# Altium project DT10965_MOTOR_CONTROLLER.PrjPcb (part 1 of 8)
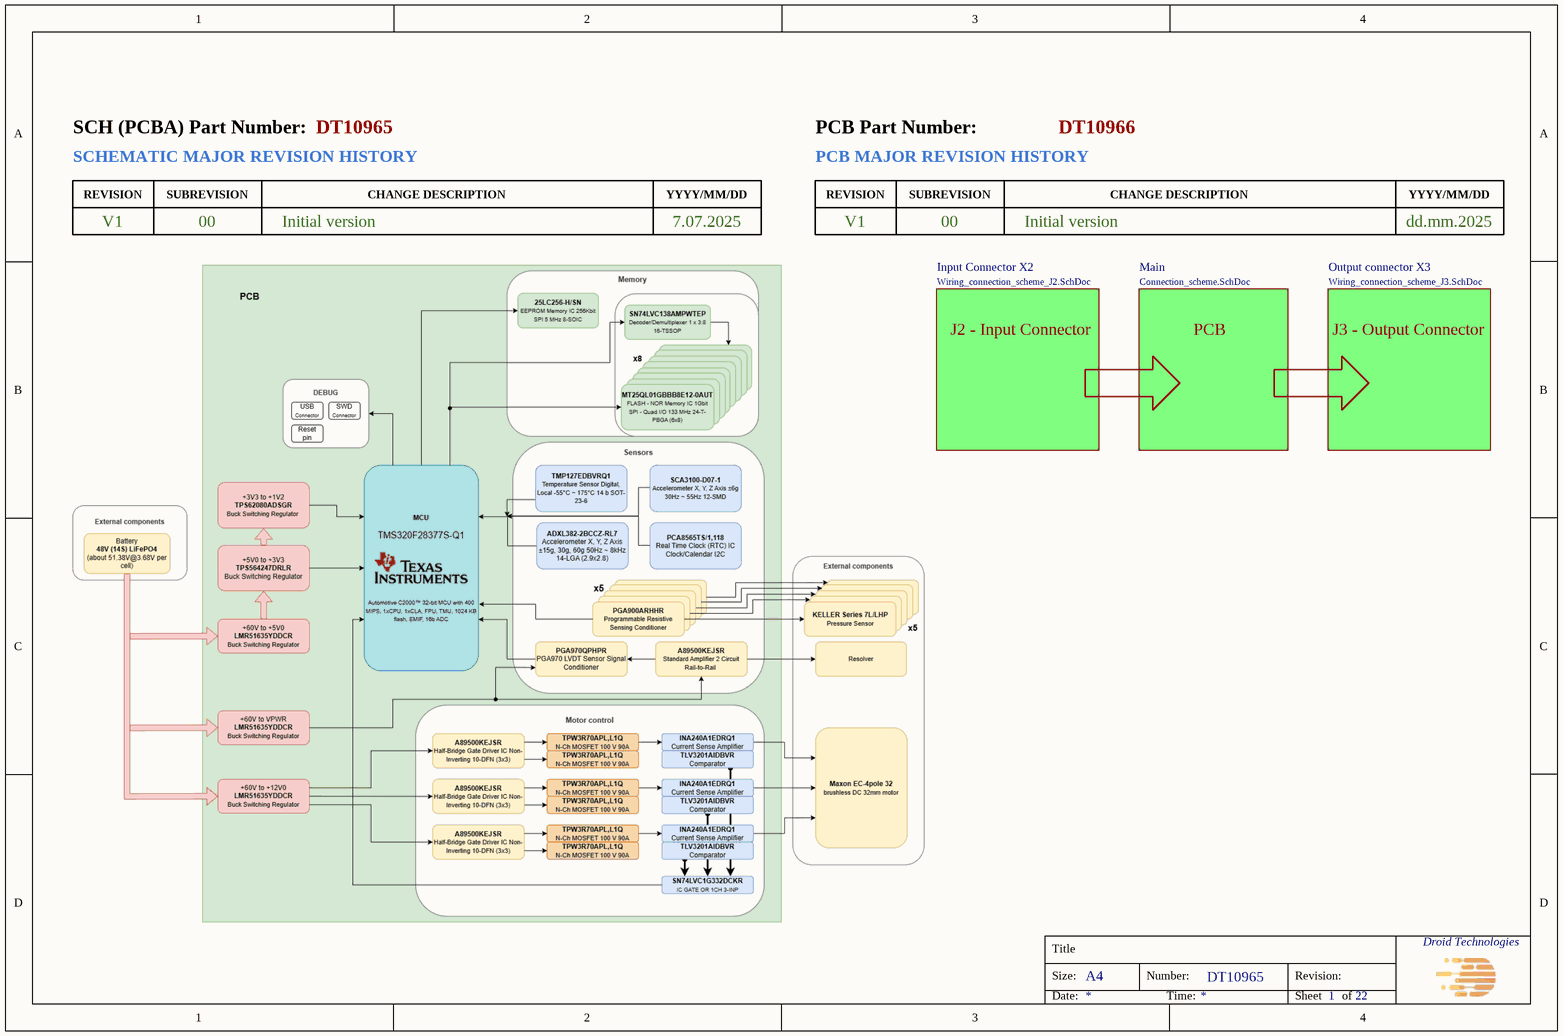
[diagram p0: Title.SchDoc]
CompanyName: Droid Technologies; DT_PCB_Number: DT10966; DT_PCB_Revision: 1.0; DT_SCH_Number: DT10965; DT_SCH_Revision: 1.0; DT_SCH_Title: MOTOR CONTROLLER
22 sheets, 745 parts. Net scope: strictly hierarchical (ports join the sheet entries above them; power ports are local).
Board file: DT10966_MOTOR_CONTROLLER.PcbDoc
Sheets:
  Title.SchDoc
    Main = Connection_scheme.SchDoc
      MCU = MCU.SchDoc
      DEBUG = MCU_debug.SchDoc
      FLASH = Flash_memory.SchDoc
      EEPROM = EEPROM_memory.SchDoc
      Temp_Sensor = Temp_sensor.SchDoc
      ACCELEROMETERS = Accelerometers.SchDoc
      H-Bridge = H-bridge.SchDoc
      Resolver = Resolver.SchDoc
      Phase Current/Voltage Sense = Phase_Current_Voltage_Sense.SchDoc
      PS1 = Pressure_sensor_AFE1.SchDoc
      Calendar = Calendar.SchDoc
      USB = USB_interface.SchDoc
      POWER = Power_management.SchDoc
      PS2 = Pressure_sensor_AFE2.SchDoc
      PS3 = Pressure_sensor_AFE3.SchDoc
      PS4 = PGA900_AFE_Reserved_4.SchDoc
      PS5 = PGA900_AFE_Reserved_5.SchDoc
      AMP = Motor Voltage AMP.SchDoc
    Input Connector X2 = Wiring_connection_scheme_J2.SchDoc
    Output connector X3 = Wiring_connection_scheme_J3.SchDoc

## Sheet Title.SchDoc: =DT_SCH_Title
size A4; Organization: Droid Technologies; DocumentNumber: DT10965; Revision: 1.0; SheetNumber: 1; SheetTotal: 22

### Sub-sheets
Input Connector X2 = Wiring_connection_scheme_J2.SchDoc: no entries
Main = Connection_scheme.SchDoc: no entries
Output connector X3 = Wiring_connection_scheme_J3.SchDoc: no entries

### Notes on the sheet
- V1
- 00
- Initial version
- 7.07.2025
- dd.mm.2025
- J2 - Input Connector
- PCB
- J3 - Output Connector
- SCHEMATIC MAJOR REVISION HISTORY
- SCH (PCBA) Part Number:
- PCB MAJOR REVISION HISTORY
- PCB Part Number:
- REVISION
- SUBREVISION
- CHANGE DESCRIPTION
- YYYY/MM/DD
- Title
- Size:
- A4
- Number:
- Revision:
- Date:
- Time:
- Sheet
- of

## Sheet Connection_scheme.SchDoc: =DT_SCH_Title
size A3; Organization: Droid Technologies; DocumentNumber: DT10965; Revision: 1.0; SheetNumber: 2; SheetTotal: 22
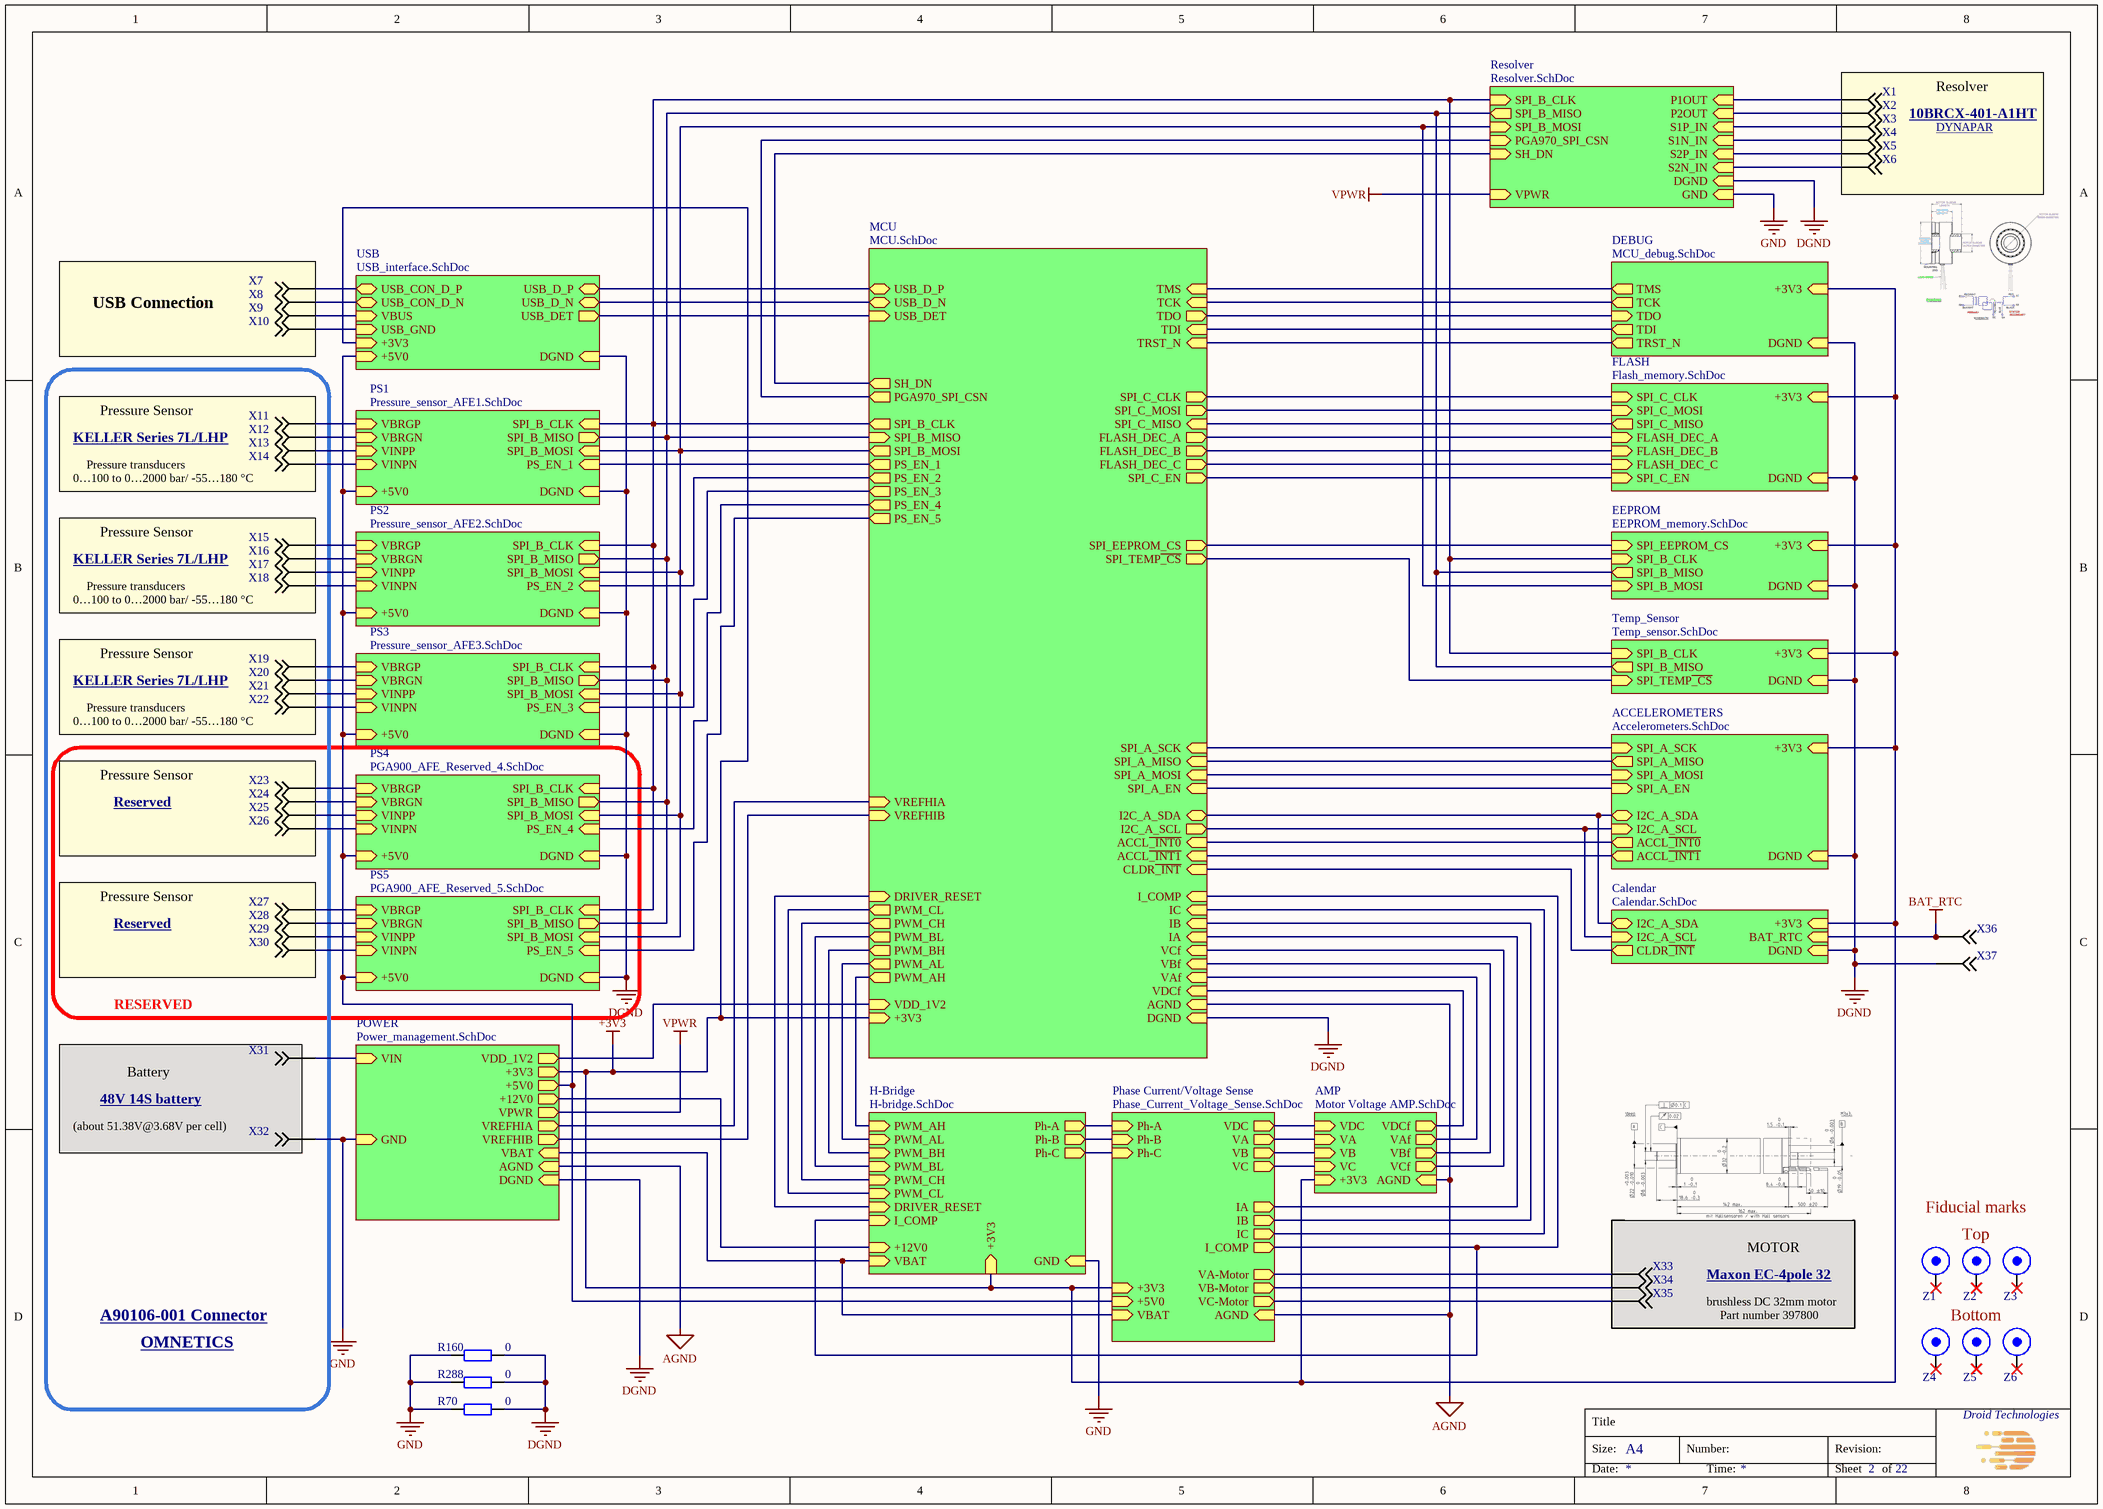
[diagram p1: Connection_scheme.SchDoc]

### Parts
R70  Resistance: 0  [RESC160X80X55L30]  (hidden comment: RC0603FR-070RL)
R160  Resistance: 0  [RESC160X80X55L30]  (hidden comment: RC0603FR-070RL)
R288  Resistance: 0  [RESC160X80X55L30]  (hidden comment: RC0603FR-070RL)
X1  PIN-TH-0.6mm  [PIN-TH-0.6mm]  (value not drawn)  (no BOM)
X2  PIN-TH-0.6mm  [PIN-TH-0.6mm]  (value not drawn)  (no BOM)
X3  PIN-TH-0.6mm  [PIN-TH-0.6mm]  (value not drawn)  (no BOM)
X4  PIN-TH-0.6mm  [PIN-TH-0.6mm]  (value not drawn)  (no BOM)
X5  PIN-TH-0.6mm  [PIN-TH-0.6mm]  (value not drawn)  (no BOM)
X6  PIN-TH-0.6mm  [PIN-TH-0.6mm]  (value not drawn)  (no BOM)
X7  PIN-TH-0.6mm  [PIN-TH-0.6mm]  (value not drawn)  (no BOM)
X8  PIN-TH-0.6mm  [PIN-TH-0.6mm]  (value not drawn)  (no BOM)
X9  PIN-TH-0.6mm  [PIN-TH-0.6mm]  (value not drawn)  (no BOM)
X10  PIN-TH-0.6mm  [PIN-TH-0.6mm]  (value not drawn)  (no BOM)
X11  PIN-TH-0.6mm  [PIN-TH-0.6mm]  (value not drawn)  (no BOM)
X12  PIN-TH-0.6mm  [PIN-TH-0.6mm]  (value not drawn)  (no BOM)
X13  PIN-TH-0.6mm  [PIN-TH-0.6mm]  (value not drawn)  (no BOM)
X14  PIN-TH-0.6mm  [PIN-TH-0.6mm]  (value not drawn)  (no BOM)
X15  PIN-TH-0.6mm  [PIN-TH-0.6mm]  (value not drawn)  (no BOM)
X16  PIN-TH-0.6mm  [PIN-TH-0.6mm]  (value not drawn)  (no BOM)
X17  PIN-TH-0.6mm  [PIN-TH-0.6mm]  (value not drawn)  (no BOM)
X18  PIN-TH-0.6mm  [PIN-TH-0.6mm]  (value not drawn)  (no BOM)
X19  PIN-TH-0.6mm  [PIN-TH-0.6mm]  (value not drawn)  (no BOM)
X20  PIN-TH-0.6mm  [PIN-TH-0.6mm]  (value not drawn)  (no BOM)
X21  PIN-TH-0.6mm  [PIN-TH-0.6mm]  (value not drawn)  (no BOM)
X22  PIN-TH-0.6mm  [PIN-TH-0.6mm]  (value not drawn)  (no BOM)
X23  PIN-TH-0.6mm  [PIN-TH-0.6mm]  (value not drawn)  (no BOM)
X24  PIN-TH-0.6mm  [PIN-TH-0.6mm]  (value not drawn)  (no BOM)
X25  PIN-TH-0.6mm  [PIN-TH-0.6mm]  (value not drawn)  (no BOM)
X26  PIN-TH-0.6mm  [PIN-TH-0.6mm]  (value not drawn)  (no BOM)
X27  PIN-TH-0.6mm  [PIN-TH-0.6mm]  (value not drawn)  (no BOM)
X28  PIN-TH-0.6mm  [PIN-TH-0.6mm]  (value not drawn)  (no BOM)
X29  PIN-TH-0.6mm  [PIN-TH-0.6mm]  (value not drawn)  (no BOM)
X30  PIN-TH-0.6mm  [PIN-TH-0.6mm]  (value not drawn)  (no BOM)
X31  PinTH_0.9mm  [PIN-TH-0.9mm]  (value not drawn)  (no BOM)
X32  PinTH_0.9mm  [PIN-TH-0.9mm]  (value not drawn)  (no BOM)
X33  PinTH_0.9mm  [PIN-TH-0.9mm]  (value not drawn)  (no BOM)
X34  PinTH_0.9mm  [PIN-TH-0.9mm]  (value not drawn)  (no BOM)
X35  PinTH_0.9mm  [PIN-TH-0.9mm]  (value not drawn)  (no BOM)
X36  PIN-TH-0.6mm  [PIN-TH-0.6mm]  (value not drawn)  (no BOM)
X37  PIN-TH-0.6mm  [PIN-TH-0.6mm]  (value not drawn)  (no BOM)
Z1  Fiducial  [REPER1.2]  (value not drawn)  (no BOM)
Z2  Fiducial  [REPER1.2]  (value not drawn)  (no BOM)
Z3  Fiducial  [REPER1.2]  (value not drawn)  (no BOM)
Z4  Fiducial  [REPER1.2]  (value not drawn)  (no BOM)
Z5  Fiducial  [REPER1.2]  (value not drawn)  (no BOM)
Z6  Fiducial  [REPER1.2]  (value not drawn)  (no BOM)

### Blocks framed on the sheet
USB Connection: X7-X10

### Sub-sheets
ACCELEROMETERS = Accelerometers.SchDoc: SPI_A_EN (in), SPI_A_MISO (out), SPI_A_MOSI (in), SPI_A_SCK (in), ACCL~{_INT0} (out), ACCL~{_INT1} (out), +3V3 (in), DGND (in), I2C_A_SCL (in), I2C_A_SDA (bidir)
AMP = Motor Voltage AMP.SchDoc: VA (in), VB (in), VC (in), VDC (in), VAf (out), VBf (out), VCf (out), VDCf (out), +3V3 (in), AGND (in)
Calendar = Calendar.SchDoc: CLDR~{_INT} (out), +3V3 (in), DGND (in), I2C_A_SCL (in), I2C_A_SDA (bidir), BAT_RTC (in)
DEBUG = MCU_debug.SchDoc: +3V3 (in), TMS (out), TCK (out), TDO (in), TDI (out), TRST_N (out), DGND (in)
EEPROM = EEPROM_memory.SchDoc: SPI_EEPROM_CS (in), SPI_B_CLK (in), SPI_B_MOSI (in), SPI_B_MISO (out), +3V3 (in), DGND (in)
FLASH = Flash_memory.SchDoc: SPI_C_CLK (in), SPI_C_MOSI (in), SPI_C_MISO (out), FLASH_DEC_A (in), FLASH_DEC_B (in), FLASH_DEC_C (in), SPI_C_EN (in), +3V3 (in), DGND (in)
H-Bridge = H-bridge.SchDoc: PWM_AH (in), PWM_AL (in), PWM_BH (in), PWM_BL (in), PWM_CH (in), PWM_CL (in), DRIVER_RESET (in), +12V0 (in), VBAT (in), Ph-A (out), Ph-B (out), Ph-C (out), GND (in), I_COMP (in), +3V3 (in)
MCU = MCU.SchDoc: TMS (in), TCK (in), TDO (out), TDI (in), TRST_N (in), +3V3 (in), DGND (in), USB_D_P (bidir), USB_D_N (bidir), VAf (in), VBf (in), VCf (in), IA (in), IB (in), IC (in), I_COMP (in), VDCf (in), PS_EN_1 (out), SPI_B_CLK (out), SPI_B_MISO (in), SPI_B_MOSI (out), PS_EN_2 (out), PS_EN_3 (out), SPI_C_CLK (out), SPI_C_MOSI (out), SPI_C_MISO (in), FLASH_DEC_A (out), FLASH_DEC_B (out), FLASH_DEC_C (out), SPI_C_EN (out), I2C_A_SCL (out), I2C_A_SDA (bidir), ACCL~{_INT1} (in), ACCL~{_INT0} (in), CLDR~{_INT} (in), VREFHIA (in), VREFHIB (in), PWM_AH (out), PWM_AL (out), PWM_BH (out), PWM_BL (out), PWM_CH (out), PWM_CL (out), DRIVER_RESET (in), PS_EN_4 (out), PS_EN_5 (out), USB_DET (in), VDD_1V2 (in), SH_DN (out), PGA970_SPI_CSN (out), SPI_A_EN (in), SPI_A_MISO (in), SPI_A_MOSI (in), SPI_A_SCK (in), SPI_EEPROM_CS (out), SPI_TEMP~{_CS} (out), AGND (in)
Phase Current/Voltage Sense = Phase_Current_Voltage_Sense.SchDoc: Ph-A (in), Ph-B (in), Ph-C (in), VA (out), VB (out), VC (out), IA (out), IB (out), IC (out), VA-Motor (out), VB-Motor (out), VC-Motor (out), +5V0 (in), VBAT (in), +3V3 (in), I_COMP (out), AGND (in), VDC (out)
POWER = Power_management.SchDoc: GND (in), VPWR (out), +3V3 (out), VDD_1V2 (out), +5V0 (out), +12V0 (out), VIN (in), VREFHIA (out), VREFHIB (out), VBAT (in), AGND (in), DGND (in)
PS1 = Pressure_sensor_AFE1.SchDoc: PS_EN_1 (in), SPI_B_CLK (in), SPI_B_MISO (out), SPI_B_MOSI (in), VBRGP (in), VBRGN (in), VINPP (in), VINPN (in), DGND (in), +5V0 (in)
PS2 = Pressure_sensor_AFE2.SchDoc: PS_EN_2 (in), SPI_B_CLK (in), SPI_B_MISO (out), SPI_B_MOSI (in), VBRGP (in), VBRGN (in), VINPP (in), VINPN (in), DGND (in), +5V0 (in)
PS3 = Pressure_sensor_AFE3.SchDoc: PS_EN_3 (in), SPI_B_CLK (in), SPI_B_MISO (out), SPI_B_MOSI (in), VBRGP (in), VBRGN (in), VINPP (in), VINPN (in), DGND (in), +5V0 (in)
PS4 = PGA900_AFE_Reserved_4.SchDoc: PS_EN_4 (in), SPI_B_CLK (in), SPI_B_MISO (out), SPI_B_MOSI (in), VBRGP (in), VBRGN (in), VINPP (in), VINPN (in), DGND (in), +5V0 (in)
PS5 = PGA900_AFE_Reserved_5.SchDoc: PS_EN_5 (in), SPI_B_CLK (in), SPI_B_MISO (out), SPI_B_MOSI (in), VBRGP (in), VBRGN (in), VINPP (in), VINPN (in), DGND (in), +5V0 (in)
Resolver = Resolver.SchDoc: PGA970_SPI_CSN (in), SPI_B_CLK (in), SPI_B_MISO (out), SPI_B_MOSI (in), SH_DN (in), GND (in), VPWR (in), P1OUT (in), P2OUT (in), S1P_IN (in), S1N_IN (in), S2P_IN (in), S2N_IN (in), DGND (in)
Temp_Sensor = Temp_sensor.SchDoc: SPI_TEMP~{_CS} (in), SPI_B_MISO (out), SPI_B_CLK (in), +3V3 (in), DGND (in)
USB = USB_interface.SchDoc: USB_CON_D_P (bidir), USB_CON_D_N (bidir), USB_D_P (bidir), USB_D_N (bidir), USB_DET (out), VBUS (in), DGND (in), USB_GND (in), +5V0 (in), +3V3 (in)

### Nets
+3V3: sheet MCU/+3V3, sheet DEBUG/+3V3, sheet FLASH/+3V3, sheet EEPROM/+3V3, sheet Temp_Sensor/+3V3, sheet ACCELEROMETERS/+3V3, sheet H-Bridge/+3V3, sheet Phase Current/Voltage Sense/+3V3, sheet Calendar/+3V3, sheet USB/+3V3, sheet POWER/+3V3, sheet AMP/+3V3
+5V0: sheet Phase Current/Voltage Sense/+5V0, sheet PS1/+5V0, sheet USB/+5V0, sheet POWER/+5V0, sheet PS2/+5V0, sheet PS3/+5V0, sheet PS4/+5V0, sheet PS5/+5V0
+12V0: sheet H-Bridge/+12V0, sheet POWER/+12V0
AGND: sheet MCU/AGND, sheet Phase Current/Voltage Sense/AGND, sheet POWER/AGND, sheet AMP/AGND
BAT_RTC: X36.1 ; sheet Calendar/BAT_RTC
DGND: R70.1 R160.1 R288.1 X37.1 ; sheet MCU/DGND, sheet DEBUG/DGND, sheet FLASH/DGND, sheet EEPROM/DGND, sheet Temp_Sensor/DGND, sheet ACCELEROMETERS/DGND, sheet Resolver/DGND, sheet PS1/DGND, sheet Calendar/DGND, sheet USB/DGND, sheet POWER/DGND, sheet PS2/DGND, sheet PS3/DGND, sheet PS4/DGND, sheet PS5/DGND
GND: R70.2 R160.2 R288.2 X32.1 ; sheet H-Bridge/GND, sheet Resolver/GND, sheet POWER/GND
VBAT: sheet H-Bridge/VBAT, sheet Phase Current/Voltage Sense/VBAT, sheet POWER/VBAT
VBUS: X9.1 ; sheet USB/VBUS
VDD_1V2: sheet MCU/VDD_1V2, sheet POWER/VDD_1V2
VIN: X31.1 ; sheet POWER/VIN
VPWR: sheet Resolver/VPWR, sheet POWER/VPWR
VREFHIA: sheet MCU/VREFHIA, sheet POWER/VREFHIA
VREFHIB: sheet MCU/VREFHIB, sheet POWER/VREFHIB
ACCL~{_INT0}: sheet MCU/ACCL~{_INT0}, sheet ACCELEROMETERS/ACCL~{_INT0}
ACCL~{_INT1}: sheet MCU/ACCL~{_INT1}, sheet ACCELEROMETERS/ACCL~{_INT1}
CLDR~{_INT}: sheet MCU/CLDR~{_INT}, sheet Calendar/CLDR~{_INT}
FLASH_DEC_A: sheet MCU/FLASH_DEC_A, sheet FLASH/FLASH_DEC_A
FLASH_DEC_B: sheet MCU/FLASH_DEC_B, sheet FLASH/FLASH_DEC_B
FLASH_DEC_C: sheet MCU/FLASH_DEC_C, sheet FLASH/FLASH_DEC_C
I2C_A_SCL: sheet MCU/I2C_A_SCL, sheet ACCELEROMETERS/I2C_A_SCL, sheet Calendar/I2C_A_SCL
I2C_A_SDA: sheet MCU/I2C_A_SDA, sheet ACCELEROMETERS/I2C_A_SDA, sheet Calendar/I2C_A_SDA
I_COMP: sheet MCU/I_COMP, sheet H-Bridge/I_COMP, sheet Phase Current/Voltage Sense/I_COMP
IA: sheet MCU/IA, sheet Phase Current/Voltage Sense/IA
IB: sheet MCU/IB, sheet Phase Current/Voltage Sense/IB
IC: sheet MCU/IC, sheet Phase Current/Voltage Sense/IC
P1OUT: X1.1 ; sheet Resolver/P1OUT
P2OUT: X2.1 ; sheet Resolver/P2OUT
PS_EN_2: sheet MCU/PS_EN_2, sheet PS2/PS_EN_2
PS_EN_3: sheet MCU/PS_EN_3, sheet PS3/PS_EN_3
PS_EN_4: sheet MCU/PS_EN_4, sheet PS4/PS_EN_4
PS_EN_5: sheet MCU/PS_EN_5, sheet PS5/PS_EN_5
S1N_IN: X4.1 ; sheet Resolver/S1N_IN
S1P_IN: X3.1 ; sheet Resolver/S1P_IN
S2N_IN: X6.1 ; sheet Resolver/S2N_IN
S2P_IN: X5.1 ; sheet Resolver/S2P_IN
SPI_A_EN: sheet MCU/SPI_A_EN, sheet ACCELEROMETERS/SPI_A_EN
SPI_A_MISO: sheet MCU/SPI_A_MISO, sheet ACCELEROMETERS/SPI_A_MISO
SPI_A_MOSI: sheet MCU/SPI_A_MOSI, sheet ACCELEROMETERS/SPI_A_MOSI
SPI_A_SCK: sheet MCU/SPI_A_SCK, sheet ACCELEROMETERS/SPI_A_SCK
SPI_B_CLK: sheet MCU/SPI_B_CLK, sheet EEPROM/SPI_B_CLK, sheet Temp_Sensor/SPI_B_CLK, sheet Resolver/SPI_B_CLK, sheet PS1/SPI_B_CLK, sheet PS2/SPI_B_CLK, sheet PS3/SPI_B_CLK, sheet PS4/SPI_B_CLK, sheet PS5/SPI_B_CLK
SPI_B_MISO: sheet MCU/SPI_B_MISO, sheet EEPROM/SPI_B_MISO, sheet Temp_Sensor/SPI_B_MISO, sheet Resolver/SPI_B_MISO, sheet PS1/SPI_B_MISO, sheet PS2/SPI_B_MISO, sheet PS3/SPI_B_MISO, sheet PS4/SPI_B_MISO, sheet PS5/SPI_B_MISO
SPI_B_MOSI: sheet MCU/SPI_B_MOSI, sheet EEPROM/SPI_B_MOSI, sheet Resolver/SPI_B_MOSI, sheet PS1/SPI_B_MOSI, sheet PS2/SPI_B_MOSI, sheet PS3/SPI_B_MOSI, sheet PS4/SPI_B_MOSI, sheet PS5/SPI_B_MOSI
SPI_C_CLK: sheet MCU/SPI_C_CLK, sheet FLASH/SPI_C_CLK
SPI_C_EN: sheet MCU/SPI_C_EN, sheet FLASH/SPI_C_EN
SPI_C_MISO: sheet MCU/SPI_C_MISO, sheet FLASH/SPI_C_MISO
SPI_C_MOSI: sheet MCU/SPI_C_MOSI, sheet FLASH/SPI_C_MOSI
SPI_EEPROM_CS: sheet MCU/SPI_EEPROM_CS, sheet EEPROM/SPI_EEPROM_CS
USB_CON_D_N: X8.1 ; sheet USB/USB_CON_D_N
USB_CON_D_P: X7.1 ; sheet USB/USB_CON_D_P
USB_D_N: sheet MCU/USB_D_N, sheet USB/USB_D_N
USB_D_P: sheet MCU/USB_D_P, sheet USB/USB_D_P
USB_DET: sheet MCU/USB_DET, sheet USB/USB_DET
VA: sheet Phase Current/Voltage Sense/VA, sheet AMP/VA
VB: sheet Phase Current/Voltage Sense/VB, sheet AMP/VB
VC: sheet Phase Current/Voltage Sense/VC, sheet AMP/VC
VDC: sheet Phase Current/Voltage Sense/VDC, sheet AMP/VDC
NetC4_2: sheet MCU/VAf, sheet AMP/VAf
NetC5_2: sheet MCU/VBf, sheet AMP/VBf
NetC6_2: sheet MCU/VCf, sheet AMP/VCf
NetC7_2: sheet MCU/VDCf, sheet AMP/VDCf
NetC70_1: sheet H-Bridge/Ph-A, sheet Phase Current/Voltage Sense/Ph-A
NetC77_1: sheet H-Bridge/Ph-B, sheet Phase Current/Voltage Sense/Ph-B
NetC85_1: sheet H-Bridge/Ph-C, sheet Phase Current/Voltage Sense/Ph-C
NetJ1_1: sheet MCU/TMS, sheet DEBUG/TMS
NetJ1_2: sheet MCU/TRST_N, sheet DEBUG/TRST_N
NetJ1_3: sheet MCU/TDI, sheet DEBUG/TDI
NetJ1_7: sheet MCU/TDO, sheet DEBUG/TDO
NetJ1_9: sheet MCU/TCK, sheet DEBUG/TCK
NetR92_1: sheet MCU/SPI_TEMP~{_CS}, sheet Temp_Sensor/SPI_TEMP~{_CS}
NetR115_1: sheet MCU/PWM_AH, sheet H-Bridge/PWM_AH
NetR117_1: sheet MCU/PWM_AL, sheet H-Bridge/PWM_AL
NetR120_1: sheet MCU/PWM_BH, sheet H-Bridge/PWM_BH
NetR122_1: sheet MCU/PWM_BL, sheet H-Bridge/PWM_BL
NetR125_1: sheet MCU/PWM_CH, sheet H-Bridge/PWM_CH
NetR127_1: sheet MCU/PWM_CL, sheet H-Bridge/PWM_CL
NetR129_2: X33.1 ; sheet Phase Current/Voltage Sense/VA-Motor
NetR139_2: X34.1 ; sheet Phase Current/Voltage Sense/VB-Motor
NetR149_2: X35.1 ; sheet Phase Current/Voltage Sense/VC-Motor
NetR169_2: sheet MCU/SH_DN, sheet Resolver/SH_DN
NetR171_2: sheet MCU/PGA970_SPI_CSN, sheet Resolver/PGA970_SPI_CSN
NetR189_2: sheet MCU/PS_EN_1, sheet PS1/PS_EN_1
NetR190_1: X13.1 ; sheet PS1/VINPP
NetR192_1: X14.1 ; sheet PS1/VINPN
NetR201_1: X10.1 ; sheet USB/USB_GND
NetR232_1: X25.1 ; sheet PS4/VINPP
NetR234_1: X26.1 ; sheet PS4/VINPN
NetR247_1: X17.1 ; sheet PS2/VINPP
NetR249_1: X18.1 ; sheet PS2/VINPN
NetR257_1: X21.1 ; sheet PS3/VINPP
NetR259_1: X22.1 ; sheet PS3/VINPN
NetR267_1: X29.1 ; sheet PS5/VINPP
NetR269_1: X30.1 ; sheet PS5/VINPN
NetTP29_1: X11.1 ; sheet PS1/VBRGP
NetTP30_1: X12.1 ; sheet PS1/VBRGN
NetTP50_1: X23.1 ; sheet PS4/VBRGP
NetTP51_1: X24.1 ; sheet PS4/VBRGN
NetTP61_1: X15.1 ; sheet PS2/VBRGP
NetTP62_1: X16.1 ; sheet PS2/VBRGN
NetTP71_1: X19.1 ; sheet PS3/VBRGP
NetTP72_1: X20.1 ; sheet PS3/VBRGN
NetTP81_1: X27.1 ; sheet PS5/VBRGP
NetTP82_1: X28.1 ; sheet PS5/VBRGN
NetU1_93: sheet MCU/DRIVER_RESET, sheet H-Bridge/DRIVER_RESET

Not connected (* = marked no-connect by the designer): Z1 1*; Z2 1*; Z3 1*; Z4 1*; Z5 1*; Z6 1*

### Notes on the sheet
- 10BRCX-401-A1HT <https://www.dynapar.com/hubfs/uploadedFiles/_site_root/Products_and_Solutions/Frameless09072012C_Pamp.pdf?hsLang=en>
- Resolver
- DYNAPAR <https://www.dynapar.com/Products_and_Solutions/Resolvers/Frameless/>
- KELLER Series 7L/LHP <https://download.keller-pressure.com/api/download/C88AJ8DXftpGtXGN9dXUXE/en/2023-07.pdf>
- Pressure Sensor
- 0…100 to 0…2000 bar/ -55…180 °C
- Pressure transducers
- Reserved <https://download.keller-pressure.com/api/download/C88AJ8DXftpGtXGN9dXUXE/en/2023-07.pdf>
- RESERVED
- (near X32) (about 51.38V@3.68V per cell)
- 48V 14S battery <https://www.chargerind.com/batteries>
- Battery
- MOTOR
- Fiducial marks
- Top
- A90106-001 Connector <https://www.omnetics.com/wp-content/uploads/2022/01/A90106-001.pdf>
- Maxon EC-4pole 32 <https://www.maxongroup.us/maxon/view/product/motor/ecmotor/ec4pole/397800>
- brushless DC 32mm motor
- Part number 397800
- Bottom
- OMNETICS <https://www.omnetics.com/product/a90106-001/>
- Title
- Size:
- A4
- Number:
- Revision:
- Date:
- Time:
- Sheet
- of

### Library data of the parts
R70 R160 R288 = CMP-001-0927-2: RES 0 OHM JUMPER 1/10W 0603; Manufacturer: YAGEO; Op Temp min: -55°C; Op Temp max: 155°C; Power: 100mW; Tolerance: 0%; Height max: 550µm; ComponentLink2URL: https://eu.mouser.com/ProductDetail/YAGEO/RC0603FR-070RL?qs=0yPvnVz5%2FmpDQv43TwvCfw%3D%3D; Temperature Coefficient: -; ComponentLink3Description: Digikey; ComponentLink2Description: Mouser; MPN: RC0603FR-070RL; ComponentLink1URL: https://www.yageo.com/upload/media/product/productsearch/datasheet/rchip/PYu-RC_Group_51_RoHS_L_12.pdf; Ratings: -; Size: 1.60mm x 0.80mm; Composition: Thick Film; Mounting Type: SM; ComponentLink3URL: https://www.digikey.com/en/products/detail/yageo/RC0603FR-070RL/1304008; Package: 0603 (1608 Metric); ComponentLink1Description: Datasheet
X1-X30 X36 X37 = PinTH_0.6mm: Pin 0.6mm diameter for 26AWG; Current Rating (Amps): 3A; Voltage Rating: 250V; ComponentLink1Description: DigiKey; ComponentLink2Description: Datasheet; Termination: Solder; Mounting Type: TH; Diameter: 0.6mm; Contact Type: Male Pin; ComponentLink3Description: Mouser
X31-X35 = PinTH_0.9mm: Pin 1.0mm diameter for 20AWG; Current Rating (Amps): 3A; Voltage Rating: 250V; ComponentLink1Description: DigiKey; ComponentLink2Description: Datasheet; Termination: Solder; Mounting Type: TH; Diameter: 0.9mm; Contact Type: Male Pin; ComponentLink3Description: Mouser
Z1-Z6 = Fiducial: MPN: Fiducail

## Sheet MCU.SchDoc: =DT_SCH_Title
size A3; Organization: Droid Technologies; DocumentNumber: DT10965; Revision: 1.0; SheetNumber: 3; SheetTotal: 22
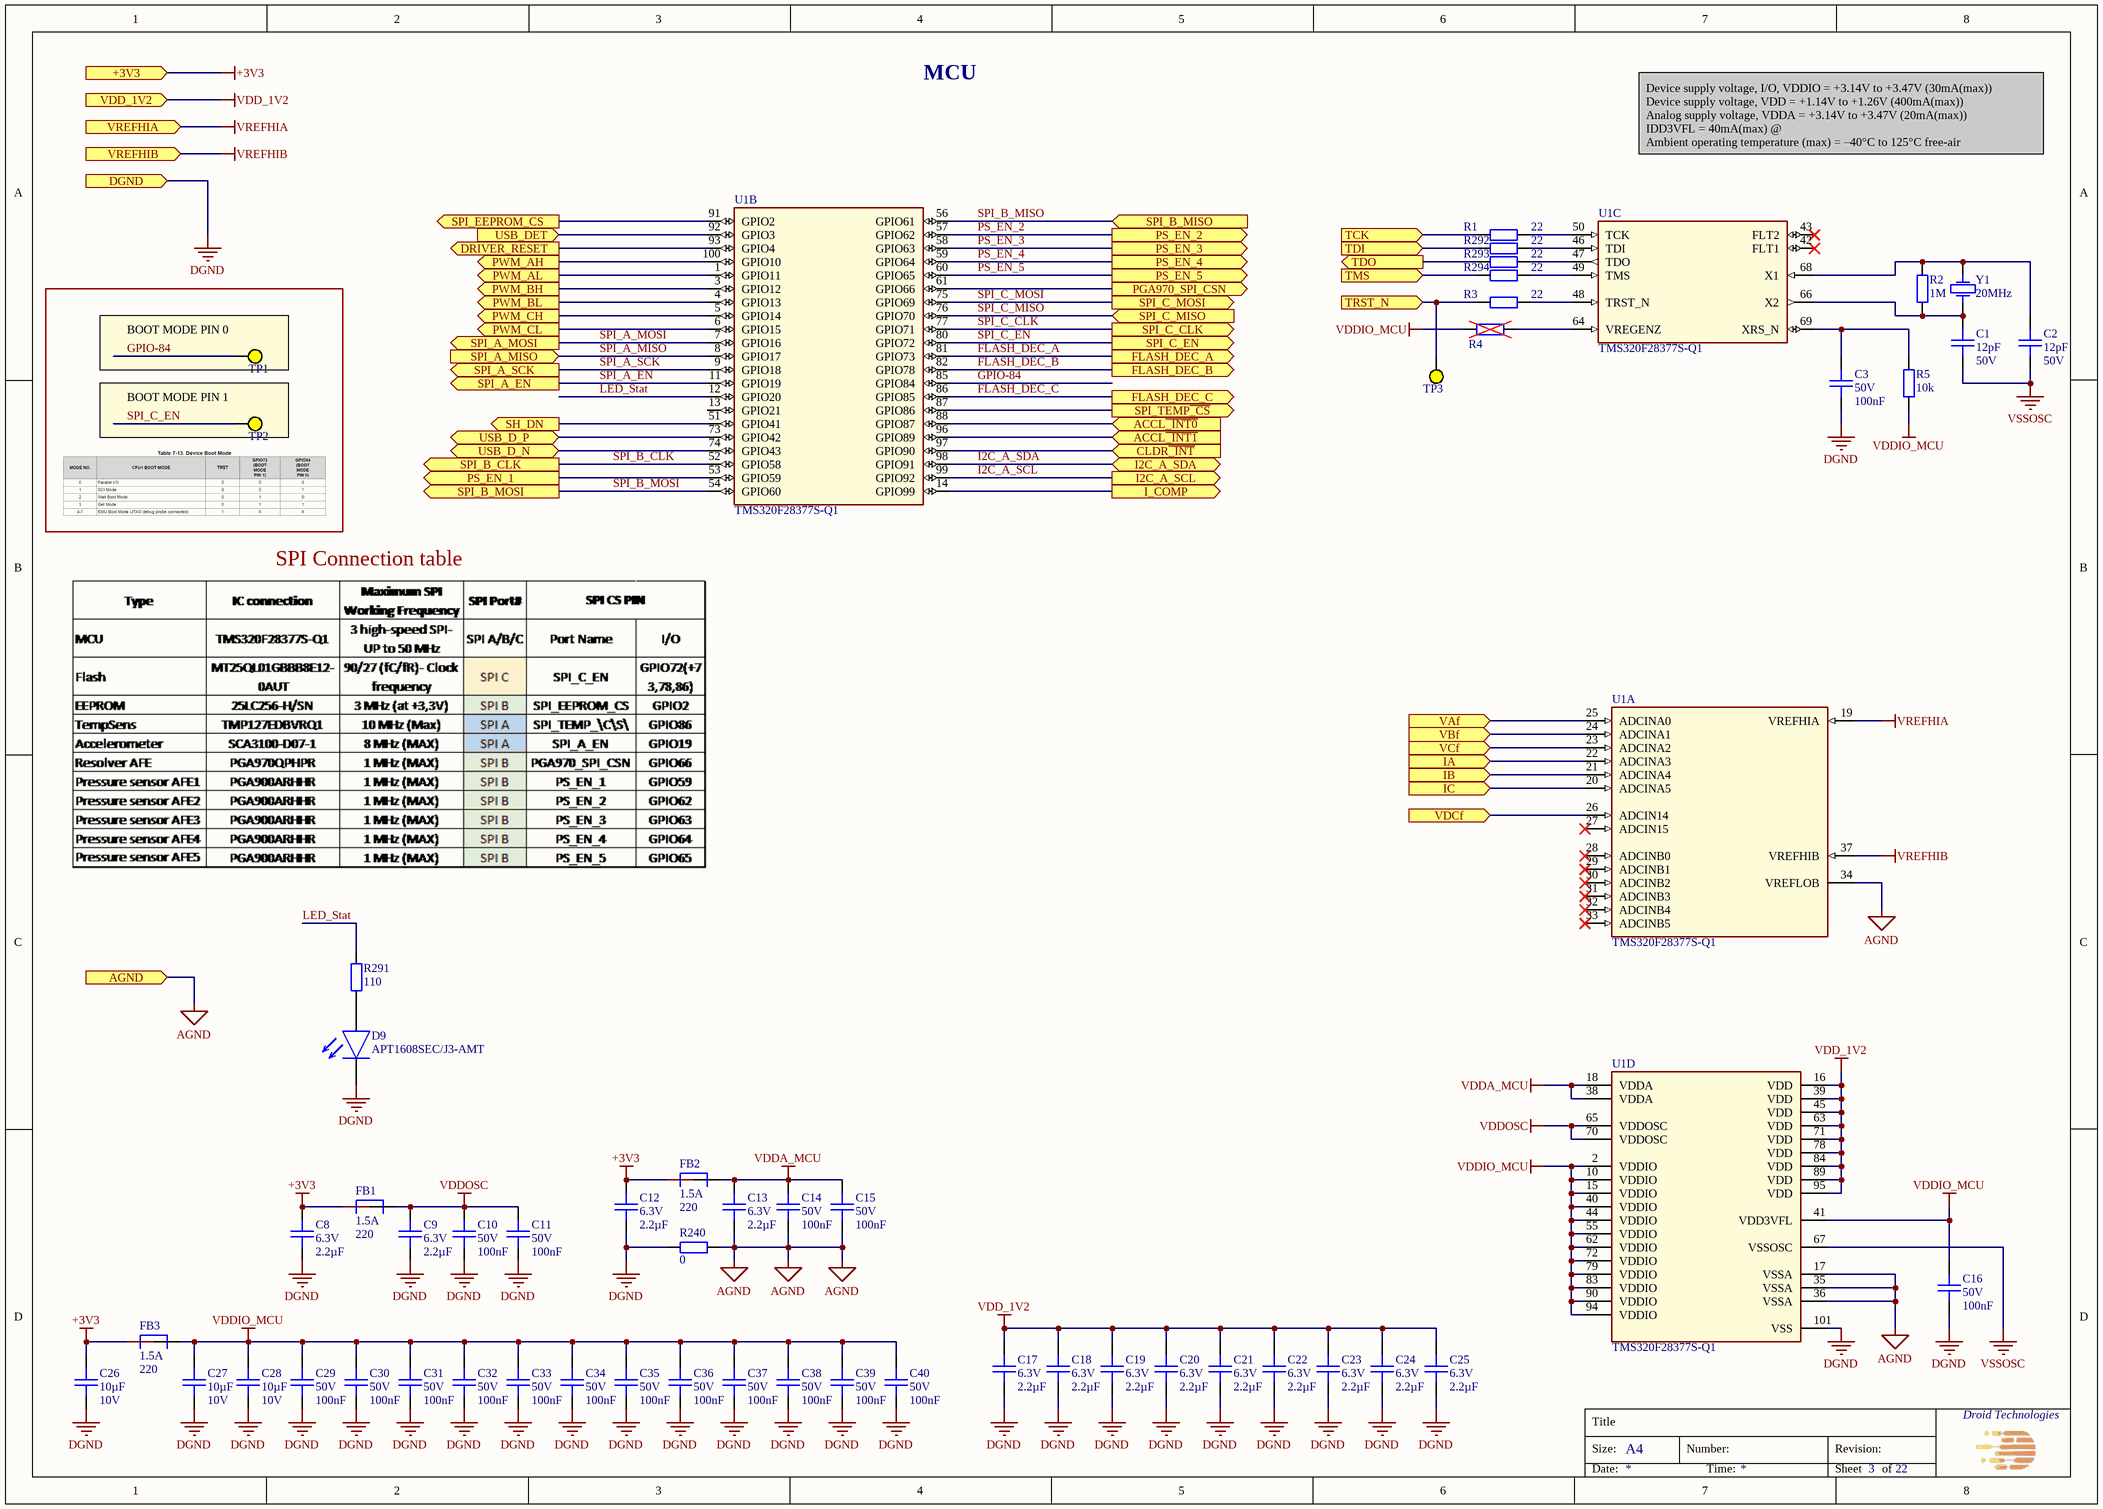
[diagram p2: MCU.SchDoc]

### Parts
C1  Capacitance: 12pF  Voltage Rating: 50V  [CAPC100x50x50L25]  (hidden comment: C0402C120J5HACAUTO)
C2  Capacitance: 12pF  Voltage Rating: 50V  [CAPC100x50x50L25]  (hidden comment: C0402C120J5HACAUTO)
C3  Voltage Rating: 50V  Capacitance: 100nF  [CAPC100x50x50L25]  (hidden comment: GCM155L8EH104KE07D)
C8  Voltage Rating: 6.3V  Capacitance: 2.2µF  [CAPC160X80X90L35]  (hidden comment: C1608X8L0J225K080AC)
C9  Voltage Rating: 6.3V  Capacitance: 2.2µF  [CAPC160X80X90L35]  (hidden comment: C1608X8L0J225K080AC)
C10  Voltage Rating: 50V  Capacitance: 100nF  [CAPC100x50x50L25]  (hidden comment: GCM155L8EH104KE07D)
C11  Voltage Rating: 50V  Capacitance: 100nF  [CAPC100x50x50L25]  (hidden comment: GCM155L8EH104KE07D)
C12  Voltage Rating: 6.3V  Capacitance: 2.2µF  [CAPC160X80X90L35]  (hidden comment: C1608X8L0J225K080AC)
C13  Voltage Rating: 6.3V  Capacitance: 2.2µF  [CAPC160X80X90L35]  (hidden comment: C1608X8L0J225K080AC)
C14  Voltage Rating: 50V  Capacitance: 100nF  [CAPC100x50x50L25]  (hidden comment: GCM155L8EH104KE07D)
C15  Voltage Rating: 50V  Capacitance: 100nF  [CAPC100x50x50L25]  (hidden comment: GCM155L8EH104KE07D)
C16  Voltage Rating: 50V  Capacitance: 100nF  [CAPC100x50x50L25]  (hidden comment: GCM155L8EH104KE07D)
C17  Voltage Rating: 6.3V  Capacitance: 2.2µF  [CAPC160X80X90L35]  (hidden comment: C1608X8L0J225K080AC)
C18  Voltage Rating: 6.3V  Capacitance: 2.2µF  [CAPC160X80X90L35]  (hidden comment: C1608X8L0J225K080AC)
C19  Voltage Rating: 6.3V  Capacitance: 2.2µF  [CAPC160X80X90L35]  (hidden comment: C1608X8L0J225K080AC)
C20  Voltage Rating: 6.3V  Capacitance: 2.2µF  [CAPC160X80X90L35]  (hidden comment: C1608X8L0J225K080AC)
C21  Voltage Rating: 6.3V  Capacitance: 2.2µF  [CAPC160X80X90L35]  (hidden comment: C1608X8L0J225K080AC)
C22  Voltage Rating: 6.3V  Capacitance: 2.2µF  [CAPC160X80X90L35]  (hidden comment: C1608X8L0J225K080AC)
C23  Voltage Rating: 6.3V  Capacitance: 2.2µF  [CAPC160X80X90L35]  (hidden comment: C1608X8L0J225K080AC)
C24  Voltage Rating: 6.3V  Capacitance: 2.2µF  [CAPC160X80X90L35]  (hidden comment: C1608X8L0J225K080AC)
C25  Voltage Rating: 6.3V  Capacitance: 2.2µF  [CAPC160X80X90L35]  (hidden comment: C1608X8L0J225K080AC)
C26  Capacitance: 10µF  Voltage Rating: 10V  [CAPC200X125X145L50]  (hidden comment: CGA4J1X8L1A106K125AC)
C27  Capacitance: 10µF  Voltage Rating: 10V  [CAPC200X125X145L50]  (hidden comment: CGA4J1X8L1A106K125AC)
C28  Capacitance: 10µF  Voltage Rating: 10V  [CAPC200X125X145L50]  (hidden comment: CGA4J1X8L1A106K125AC)
C29  Voltage Rating: 50V  Capacitance: 100nF  [CAPC100x50x50L25]  (hidden comment: GCM155L8EH104KE07D)
C30  Voltage Rating: 50V  Capacitance: 100nF  [CAPC100x50x50L25]  (hidden comment: GCM155L8EH104KE07D)
C31  Voltage Rating: 50V  Capacitance: 100nF  [CAPC100x50x50L25]  (hidden comment: GCM155L8EH104KE07D)
C32  Voltage Rating: 50V  Capacitance: 100nF  [CAPC100x50x50L25]  (hidden comment: GCM155L8EH104KE07D)
C33  Voltage Rating: 50V  Capacitance: 100nF  [CAPC100x50x50L25]  (hidden comment: GCM155L8EH104KE07D)
C34  Voltage Rating: 50V  Capacitance: 100nF  [CAPC100x50x50L25]  (hidden comment: GCM155L8EH104KE07D)
C35  Voltage Rating: 50V  Capacitance: 100nF  [CAPC100x50x50L25]  (hidden comment: GCM155L8EH104KE07D)
C36  Voltage Rating: 50V  Capacitance: 100nF  [CAPC100x50x50L25]  (hidden comment: GCM155L8EH104KE07D)
C37  Voltage Rating: 50V  Capacitance: 100nF  [CAPC100x50x50L25]  (hidden comment: GCM155L8EH104KE07D)
C38  Voltage Rating: 50V  Capacitance: 100nF  [CAPC100x50x50L25]  (hidden comment: GCM155L8EH104KE07D)
C39  Voltage Rating: 50V  Capacitance: 100nF  [CAPC100x50x50L25]  (hidden comment: GCM155L8EH104KE07D)
C40  Voltage Rating: 50V  Capacitance: 100nF  [CAPC100x50x50L25]  (hidden comment: GCM155L8EH104KE07D)
D9  APT1608SEC/J3-AMT  [APT1608SECJ3AMT]
FB1  Imax: 1.5A  Impedance: 220  [BEADC160X80X95L40]  (hidden comment: BLM18KG221BH1D)
FB2  Imax: 1.5A  Impedance: 220  [BEADC160X80X95L40]  (hidden comment: BLM18KG221BH1D)
FB3  Imax: 1.5A  Impedance: 220  [BEADC160X80X95L40]  (hidden comment: BLM18KG221BH1D)
R1  Resistance: 22  [RESC100X50X40L25]  (hidden comment: RC0402FR-0722RL)
R2  Resistance: 1M  [RESC100X50X40L25]  (hidden comment: RC0402FR-071ML)
R3  Resistance: 22  [RESC100X50X40L25]  (hidden comment: RC0402FR-0722RL)
R4  DNP chip res 0603  [RESC160X80X55L30]  (value not drawn)
R5  Resistance: 10k  [RESC100X50X40L25]  (hidden comment: RC0402FR-0710KL)
R240  Resistance: 0  [RESC160X80X55L30]  (hidden comment: RC0603FR-070RL)
R291  Resistance: 110  [RESC100X50X40L25]  (hidden comment: RC0402FR-07110RL)
R292  Resistance: 22  [RESC100X50X40L25]  (hidden comment: RC0402FR-0722RL)
R293  Resistance: 22  [RESC100X50X40L25]  (hidden comment: RC0402FR-0722RL)
R294  Resistance: 22  [RESC100X50X40L25]  (hidden comment: RC0402FR-0722RL)
TP1  Test Point  [TP_D1.5mm]  (value not drawn)  (no BOM)
TP2  Test Point  [TP_D1.5mm]  (value not drawn)  (no BOM)
TP3  Test Point  [TP_D0.75mm]  (value not drawn)  (no BOM)
U1  TMS320F28377S-Q1  [100-HTQFP (14x14)]  (parts A,B,C,D of 4)
Y1  20MHz  [NX5032GA]

### Blocks framed on the sheet
BOOT MODE PIN 0: TP1
BOOT MODE PIN 1: TP2

### Ports
+3V3 (in), ACCL~{_INT0} (in), ACCL~{_INT1} (in), AGND (in), CLDR~{_INT} (in), DGND (in), DRIVER_RESET (out), FLASH_DEC_A (out), FLASH_DEC_B (out), FLASH_DEC_C (out), I2C_A_SCL (out), I2C_A_SDA (bidir), I_COMP (out), IA (in), IB (in), IC (in), PGA970_SPI_CSN (out), PS_EN_1 (out), PS_EN_2 (out), PS_EN_3 (out), PS_EN_4 (out), PS_EN_5 (out), PWM_AH (out), PWM_AL (out), PWM_BH (out), PWM_BL (out), PWM_CH (out), PWM_CL (out), SH_DN (out), SPI_A_EN (out), SPI_A_MISO (in), SPI_A_MOSI (out), SPI_A_SCK (out), SPI_B_CLK (out), SPI_B_MISO (in), SPI_B_MOSI (out), SPI_C_CLK (out), SPI_C_EN (out), SPI_C_MISO (in), SPI_C_MOSI (out), SPI_EEPROM_CS (out), SPI_TEMP~{_CS} (out), TCK (in), TDI (in), TDO (out), TMS (in), TRST_N (in), USB_D_N (bidir), USB_D_P (bidir), USB_DET (in), VAf (in), VBf (in), VCf (in), VDCf (in), VDD_1V2 (in), VREFHIA (in), VREFHIB (in)

### Nets
+3V3: C8.2 C12.2 C26.2 FB1.1 FB2.1 FB3.1 ; port +3V3
AGND: C13.1 C14.1 C15.1 R240.1 U1.17(VSSA) U1.34(VREFLOB) U1.35(VSSA) U1.36(VSSA) ; port AGND
DGND: C3.1 C8.1 C9.1 C10.1 C11.1 C12.1 C16.1 C17.1 C18.1 C19.1 C20.1 C21.1 C22.1 C23.1 C24.1 C25.1 C26.1 C27.1 C28.1 C29.1 C30.1 C31.1 C32.1 C33.1 C34.1 C35.1 C36.1 C37.1 C38.1 C39.1 C40.1 D9.2(C) R240.2 U1.101(VSS) ; port DGND
VDD_1V2: C17.2 C18.2 C19.2 C20.2 C21.2 C22.2 C23.2 C24.2 C25.2 U1.16(VDD) U1.39(VDD) U1.45(VDD) U1.63(VDD) U1.71(VDD) U1.78(VDD) U1.84(VDD) U1.89(VDD) U1.95(VDD) ; port VDD_1V2
VDDA_MCU: C13.2 C14.2 C15.2 FB2.2 U1.18(VDDA) U1.38(VDDA)
VDDIO_MCU: C16.2 C27.2 C28.2 C29.2 C30.2 C31.2 C32.2 C33.2 C34.2 C35.2 C36.2 C37.2 C38.2 C39.2 C40.2 FB3.2 R4.2 R5.1 U1.2(VDDIO) U1.10(VDDIO) U1.15(VDDIO) U1.40(VDDIO) U1.41(VDD3VFL) U1.44(VDDIO) U1.55(VDDIO) U1.62(VDDIO) U1.72(VDDIO) U1.79(VDDIO) U1.83(VDDIO) U1.90(VDDIO) U1.94(VDDIO)
VDDOSC: C9.2 C10.2 C11.2 FB1.2 U1.65(VDDOSC) U1.70(VDDOSC)
VREFHIA: U1.19(VREFHIA) ; port VREFHIA
VREFHIB: U1.37(VREFHIB) ; port VREFHIB
VSSOSC: C1.2 C2.2 U1.67(VSSOSC)
ACCL~{_INT0}: U1.88(GPIO87) ; port ACCL~{_INT0}
ACCL~{_INT1}: U1.96(GPIO89) ; port ACCL~{_INT1}
CLDR~{_INT}: U1.97(GPIO90) ; port CLDR~{_INT}
FLASH_DEC_A: U1.81(GPIO73) ; port FLASH_DEC_A
FLASH_DEC_B: U1.82(GPIO78) ; port FLASH_DEC_B
FLASH_DEC_C: U1.86(GPIO85) ; port FLASH_DEC_C
GPIO-84: TP1.1 U1.85(GPIO84)
I2C_A_SCL: U1.99(GPIO92) ; port I2C_A_SCL
I2C_A_SDA: U1.98(GPIO91) ; port I2C_A_SDA
I_COMP: U1.14(GPIO99) ; port I_COMP
IA: U1.22(ADCINA3) ; port IA
IB: U1.21(ADCINA4) ; port IB
IC: U1.20(ADCINA5) ; port IC
LED_Stat: R291.2 U1.12(GPIO20)
PS_EN_2: U1.57(GPIO62) ; port PS_EN_2
PS_EN_3: U1.58(GPIO63) ; port PS_EN_3
PS_EN_4: U1.59(GPIO64) ; port PS_EN_4
PS_EN_5: U1.60(GPIO65) ; port PS_EN_5
SPI_A_EN: U1.11(GPIO19) ; port SPI_A_EN
SPI_A_MISO: U1.8(GPIO17) ; port SPI_A_MISO
SPI_A_MOSI: U1.7(GPIO16) ; port SPI_A_MOSI
SPI_A_SCK: U1.9(GPIO18) ; port SPI_A_SCK
SPI_B_CLK: U1.52(GPIO58) ; port SPI_B_CLK
SPI_B_MISO: U1.56(GPIO61) ; port SPI_B_MISO
SPI_B_MOSI: U1.54(GPIO60) ; port SPI_B_MOSI
SPI_C_CLK: U1.77(GPIO71) ; port SPI_C_CLK
SPI_C_EN: TP2.1 U1.80(GPIO72) ; port SPI_C_EN
SPI_C_MISO: U1.76(GPIO70) ; port SPI_C_MISO
SPI_C_MOSI: U1.75(GPIO69) ; port SPI_C_MOSI
SPI_EEPROM_CS: U1.91(GPIO2) ; port SPI_EEPROM_CS
USB_D_N: U1.74(GPIO43) ; port USB_D_N
USB_D_P: U1.73(GPIO42) ; port USB_D_P
USB_DET: U1.92(GPIO3) ; port USB_DET
NetC1_1: C1.1 R2.1 U1.66(X2) Y1.1
NetC2_1: C2.1 R2.2 U1.68(X1) Y1.2
NetC3_2: C3.2 R5.2 U1.69(XRS_N)
NetC4_2: U1.25(ADCINA0) ; port VAf
NetC5_2: U1.24(ADCINA1) ; port VBf
NetC6_2: U1.23(ADCINA2) ; port VCf
NetC7_2: U1.26(ADCIN14) ; port VDCf
NetD9_1: D9.1(A) R291.1
NetJ1_1: R294.1 ; port TMS
NetJ1_2: R3.1 TP3.1 ; port TRST_N
NetJ1_3: R292.1 ; port TDI
NetJ1_7: R293.1 ; port TDO
NetJ1_9: R1.1 ; port TCK
NetR1_2: R1.2 U1.50(TCK)
NetR3_2: R3.2 U1.48(TRST_N)
NetR4_1: R4.1 U1.64(VREGENZ)
NetR92_1: U1.87(GPIO86) ; port SPI_TEMP~{_CS}
NetR115_1: U1.100(GPIO10) ; port PWM_AH
NetR117_1: U1.1(GPIO11) ; port PWM_AL
NetR120_1: U1.3(GPIO12) ; port PWM_BH
NetR122_1: U1.4(GPIO13) ; port PWM_BL
NetR125_1: U1.5(GPIO14) ; port PWM_CH
NetR127_1: U1.6(GPIO15) ; port PWM_CL
NetR169_2: U1.51(GPIO41) ; port SH_DN
NetR171_2: U1.61(GPIO66) ; port PGA970_SPI_CSN
NetR189_2: U1.53(GPIO59) ; port PS_EN_1
NetR292_2: R292.2 U1.46(TDI)
NetR293_2: R293.2 U1.47(TDO)
NetR294_2: R294.2 U1.49(TMS)
NetU1_93: U1.93(GPIO4) ; port DRIVER_RESET

Not connected (* = marked no-connect by the designer): U1 13(GPIO21) 27(ADCIN15)* 28(ADCINB0)* 29(ADCINB1)* 30(ADCINB2)* 31(ADCINB3)* 32(ADCINB4)* 33(ADCINB5)* 42(FLT1)* 43(FLT2)*

### Notes on the sheet
- MCU
- Device supply voltage, I/O, VDDIO = +3.14V to +3.47V (30mA(max))
  Device supply voltage, VDD = +1.14V to +1.26V (400mA(max))
  Analog supply voltage, VDDA = +3.14V to +3.47V (20mA(max))
  IDD3VFL = 40mA(max) @
  Ambient operating temperature (max) = –40°C to 125°C free-air
- SPI Connection table
- Title
- Size:
- A4
- Number:
- Revision:
- Date:
- Time:
- Sheet
- of

### Library data of the parts
C1 C2 = CMP-001-2042-2: CAP CER 0402 12PF 50V ULTRA STAB; Manufacturer: KEMET; Tolerance: 5%; Op Temp min: -55°C; Dielectric: X8R; Op Temp max: 150°C; ComponentLink3URL: https://www.digikey.com/en/products/detail/kemet/C0402C120J5HACAUTO/7955501; ComponentLink1Description: Datasheet; ComponentLink2URL: https://eu.mouser.com/ProductDetail/KEMET/C0402C120J5HACAUTO?qs=j%252B1pi9TdxUZTSOjjZ2f5wA%3D%3D; Size: 1.00mm x 0.50mm; ComponentLink2Description: Mouser; Ratings: AEC-Q200; ComponentLink3Description: Digikey; Mounting Type: SM; Lead Spacing: 0mm; MPN: C0402C120J5HACAUTO; ComponentLink1URL: https://search.kemet.com/component-documentation/download/specsheet/C0402C120J5HACAUTO; Height max: 550µm; Package: 0402 (1005 Metric)
C3 C10 C11 C14-C16 C29-C40 = CMP-001-1980-2: CAP CER 0.1UF 50V X8L 0402; Manufacturer: Murata Electronics; Op Temp max: 150°C; Op Temp min: -55°C; Tolerance: 10%; Height max: 550µm; ComponentLink3Description: Digikey; Mounting Type: SM; ComponentLink3URL: https://www.digikey.com/en/products/detail/murata-electronics/GCM155L8EH104KE07D/11618823; Package: 0402 (1005 Metric); Lead Spacing: 0mm; MPN: GCM155L8EH104KE07D; Size: 1.00mm x 0.50mm; Ratings: AEC-Q200; ComponentLink1URL: https://www.murata.com/en-us/products/productdetail?partno=GCM155L8EH104KE07%23; ComponentLink1Description: Datasheet; Dielectric: X8L; ComponentLink2Description: Mouser; ComponentLink2URL: https://eu.mouser.com/ProductDetail/Murata-Electronics/GCM155L8EH104KE07D?qs=1mbolxNpo8fQSHf0HYnZWw%3D%3D
C8 C9 C12 C13 C17-C25 = CMP-001-2044-2: CAP CER 2.2UF 6.3V X8L 0603; Manufacturer: TDK Corporation; Op Temp min: -55°C; Tolerance: 10%; Op Temp max: 150°C; ComponentLink1URL: https://product.tdk.com/en/search/capacitor/ceramic/mlcc/info?part_no=C1608X8L0J225K080AC; MPN: C1608X8L0J225K080AC; ComponentLink3URL: https://www.digikey.com/en/products/detail/tdk-corporation/C1608X8L0J225K080AC/8343784; ComponentLink1Description: Datasheet; Lead Spacing: 0mm; ComponentLink3Description: Digikey; Package: 0603 (1608 Metric); Height max: 900µm; Size: 1.60mm x 0.80mm; Dielectric: X8L; Ratings: -; Mounting Type: SM; ComponentLink2URL: https://eu.mouser.com/ProductDetail/TDK/C1608X8L0J225K080AC?qs=rrS6PyfT74dgREMaiAoT3Q%3D%3D; ComponentLink2Description: Mouser
C26-C28 = CMP-001-1984-2: CAP CER 10UF 10V X8L 0805; Manufacturer: TDK Corporation; Tolerance: 10%; Op Temp min: -55°C; Op Temp max: 150°C; ComponentLink3Description: Digikey; Mounting Type: SM; Ratings: AEC-Q200; ComponentLink1Description: Datasheet; ComponentLink3URL: https://www.digikey.com/en/products/detail/tdk-corporation/CGA4J1X8L1A106K125AC/9991388; Lead Spacing: 0mm; MPN: CGA4J1X8L1A106K125AC; Size: 2.00mm x 1.25mm; Height max: 1.5mm; ComponentLink2URL: https://eu.mouser.com/ProductDetail/TDK/CGA4J1X8L1A106K125AC?qs=gZXFycFWdANzH%252B2UvJJjtQ%3D%3D; Package: 0805 (2012 Metric); ComponentLink2Description: Mouser; Dielectric: X8L; ComponentLink1URL: https://product.tdk.com/en/search/capacitor/ceramic/mlcc/info?part_no=CGA4J1X8L1A106K125AC
D9 = LED_APT1608SEC/J3-AMT: LED COOL WHITE DIFFUSED 0402 SMD; Mnf: Kingbright; Colour: Red; Voltage: 2.2V; Current - Test: 20mA; Lens style: Rectangle with Flat Top; Wavelength - Dominant: 623nm; Viewing Angle: 120°; Millicandela Rating: 900mcd; Size / Dimension: 1.60mm L x 0.85mm W; MPN: APT1608SEC/J3-AMT; ComponentLink1Description: Datasheet; ComponentLink1URL: https://www.kingbrightusa.com/images/catalog/SPEC/APT1608SEC-J3-AMT.pdf; ComponentLink2Description: DigiKey; ComponentLink2URL: https://www.digikey.lt/en/products/detail/kingbright/APT1608SEC-J3-AMT/17969025?s=N4IgTCBcDaIIIAUAqBGAbABgBwGUCiAwgPQBSAzALRwCySIAugL5A; ComponentLink3Description: Mouser; ComponentLink3URL: https://eu.mouser.com/ProductDetail/Kingbright/APT1608SEC-J3-AMT?qs=0pUdBCiL%2F4PrQrm2zkbL8w%3D%3D; Mounting Type: SM; Package / Case: 0603 (1608 Metric); Height (MAX): 0.85mm
FB1-FB3 = CMP-001-1981-1: FERRITE BEAD 220 OHM 0603 1LN; Manufacturer: Murata Electronics; DCR: 50m; Op Temp min: -55°C; Frequency: 100MHz; Op Temp max: 150°C; Number of Lines: 1; Mounting Type: SM; Size: 1.60mm x 0.80mm; ComponentLink2URL: https://eu.mouser.com/ProductDetail/Murata-Electronics/BLM18KG221BH1D?qs=sJ5gq5MLFXpgEHYBdWUtkQ%3D%3D; ComponentLink1Description: Datasheet; ComponentLink1URL: https://www.murata.com/en-us/products/productdata/8798137286686/QNFA9129.pdf; Lead Spacing: 0mm; Ratings: AEC-Q200; ComponentLink3Description: Digikey; ComponentLink3URL: https://www.digikey.com/en/products/detail/murata-electronics/BLM18KG221BH1D/6156000; Height max: 950µm; Package: 0603 (1608 Metric); ComponentLink2Description: Mouser; MPN: BLM18KG221BH1D
R1 R3 R292-R294 = CMP-001-0482-4: RES 22 OHM 1% 1/16W 0402; Manufacturer: YAGEO; Temperature Coefficient: ±100ppm; Op Temp max: 155°C; Op Temp min: -55°C; Power: 63mW; Ratings: -; ComponentLink3URL: https://www.digikey.com/en/products/detail/yageo/RC0402FR-0722RL/726562; ComponentLink2URL: https://eu.mouser.com/ProductDetail/YAGEO/RC0402FR-0722RL?qs=V1yeUXFNrkkRg6zf08ADKQ%3D%3D; MPN: RC0402FR-0722RL; ComponentLink1Description: Datasheet; ComponentLink3Description: Digikey; Tolerance: 1%; Size: 1.00mm x 0.50mm; ComponentLink1URL: https://www.yageo.com/upload/media/product/productsearch/datasheet/rchip/PYu-RC_Group_51_RoHS_L_12.pdf; Composition: Thick Film; ComponentLink2Description: Mouser; Mounting Type: SM; Package: 0402 (1005 Metric); Height max: 400µm
R2 = CMP-00539-4: RES 1M OHM 1% 1/16W 0402; Manufacturer: YAGEO; Op Temp max: 155°C; Op Temp min: -55°C; Temperature Coefficient: ±100ppm; Power: 63mW; Ratings: -; ComponentLink2URL: https://eu.mouser.com/ProductDetail/YAGEO/RC0402FR-071ML?qs=V1yeUXFNrknfoI4987wfBQ%3D%3D; Height max: 400µm; ComponentLink1Description: Datasheet; Mounting Type: SM; ComponentLink2Description: Mouser; Package: 0402 (1005 Metric); ComponentLink3URL: https://www.digikey.com/en/products/detail/yageo/RC0402FR-071ML/726515; MPN: RC0402FR-071ML; Tolerance: 1%; ComponentLink1URL: https://www.yageo.com/upload/media/product/productsearch/datasheet/rchip/PYu-RC_Group_51_RoHS_L_12.pdf; Composition: Thick Film; Size: 1.00mm x 0.50mm; ComponentLink3Description: Digikey
R4 = CMP-001-0920-3: DNP res 0603; Mounting Type: SM; MPN: DNP; Package: 0603 (1608 Metric)
R5 = CMP-00010-6: RES 10K OHM 1% 1/16W 0402; Manufacturer: YAGEO; Op Temp max: 155°C; Op Temp min: -55°C; Power: 63mW; Temperature Coefficient: ±100ppm; ComponentLink3URL: https://www.digikey.com/en/products/detail/yageo/RC0402FR-0710KL/726523; ComponentLink1Description: Datasheet; Height max: 400µm; ComponentLink3Description: Digikey; ComponentLink2URL: https://www2.mouser.com/ProductDetail/YAGEO/RC0402FR-0710KL?qs=%2Fha2pyFaduhjtLcYvKXQ8NAGbRXkQ%2Fwl6RsvWHeV66MSeqLhkcF3rg%3D%3D; Ratings: -; MPN: RC0402FR-0710KL; ComponentLink1URL: https://www.yageo.com/upload/media/product/productsearch/datasheet/rchip/PYu-RC_Group_51_RoHS_L_12.pdf; ComponentLink2Description: Mouser; Mounting Type: SM; Tolerance: 1%; Composition: Thick Film; Size: 1.00mm x 0.50mm; Package: 0402 (1005 Metric)
R240 = CMP-001-0927-2: as R70 on sheet Connection_scheme; Height max: 550µm; ComponentLink2URL: https://eu.mouser.com/ProductDetail/YAGEO/RC0603FR-070RL?qs=0yPvnVz5%2FmpDQv43TwvCfw%3D%3D; Temperature Coefficient: -; ComponentLink3Description: Digikey; ComponentLink2Description: Mouser; MPN: RC0603FR-070RL; ComponentLink1URL: https://www.yageo.com/upload/media/product/productsearch/datasheet/rchip/PYu-RC_Group_51_RoHS_L_12.pdf; Ratings: -; Size: 1.60mm x 0.80mm; Composition: Thick Film; Mounting Type: SM; ComponentLink3URL: https://www.digikey.com/en/products/detail/yageo/RC0603FR-070RL/1304008; Package: 0603 (1608 Metric); ComponentLink1Description: Datasheet
R291 = CMP-001-0497-6: RES 110 OHM 1% 1/16W 0402; Manufacturer: YAGEO; Power: 63mW; Op Temp min: -55°C; Op Temp max: 155°C; Temperature Coefficient: ±100ppm; Size: 1.00mm x 0.50mm; ComponentLink1Description: Datasheet; Package: 0402 (1005 Metric); ComponentLink2URL: https://eu.mouser.com/ProductDetail/YAGEO/RC0402FR-07110RL?qs=QWYorlrD8IXj7iGvwWbRbA%3D%3D; MPN: RC0402FR-07110RL; ComponentLink3Description: Digikey; Height max: 400µm; Ratings: -; ComponentLink3URL: https://www.digikey.com/en/products/detail/yageo/RC0402FR-07110RL/2827583; Composition: Thick Film; ComponentLink2Description: Mouser; Tolerance: 1%; Mounting Type: SM; ComponentLink1URL: https://www.yageo.com/upload/media/product/productsearch/datasheet/rchip/PYu-RC_Group_51_RoHS_L_12.pdf
TP1 TP2 = TP_1.5
TP3 = TP_0.75: Test point 0.75mm
U1 = TMS320F28377SPZPQ: IC MCU 32BIT 1MB FLASH 100HTQFP; Manufacturer: Texas Instruments; MPN: TMS320F28377SPZPQ
Y1 = STDCSU2-20M: CRYSTAL 20.0000MHZ 8PF SMD; Manufacturer: NDK (NIHON DEMPA KOGYO CO., LTD); MPN: STDCSU2-20M

## Sheet MCU_debug.SchDoc: =DT_SCH_Title
size A4; Organization: Droid Technologies; DocumentNumber: DT10965; Revision: 1.0; SheetNumber: 4; SheetTotal: 22
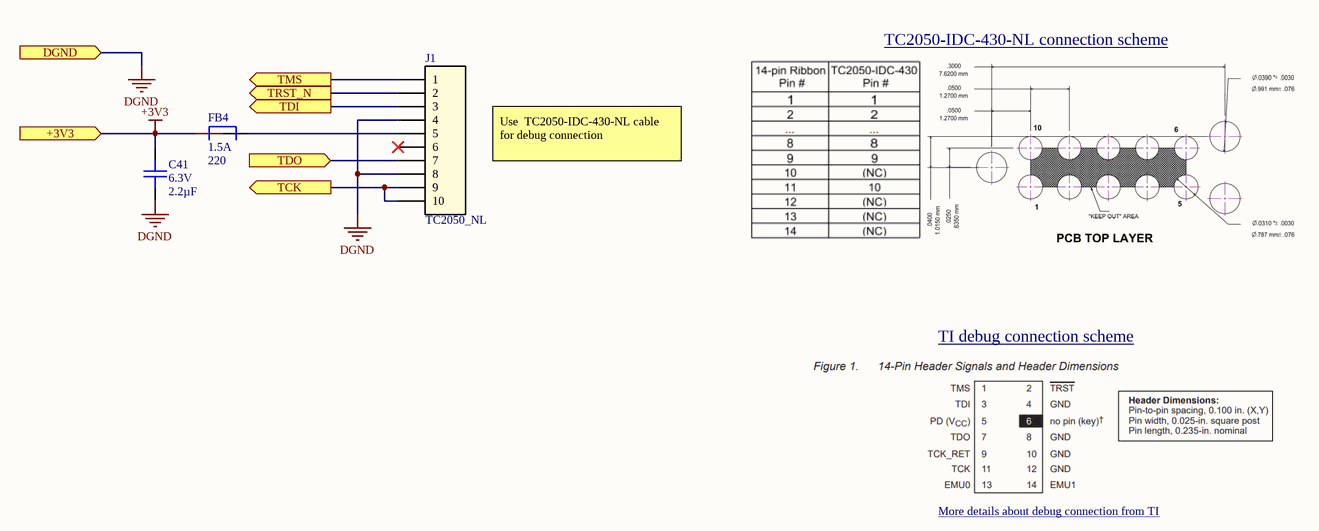
[diagram p3: MCU_debug.SchDoc]

### Parts
C41  Voltage Rating: 6.3V  Capacitance: 2.2µF  [CAPC160X80X90L35]  (hidden comment: C1608X8L0J225K080AC)
FB4  Imax: 1.5A  Impedance: 220  [BEADC160X80X95L40]  (hidden comment: BLM18KG221BH1D)
J1  TC2050_NL  [CONN__TAG_TC2050-IDC-NL]  (no BOM)

### Ports
+3V3 (in), DGND (in), TCK (out), TDI (out), TDO (in), TMS (out), TRST_N (out)

### Nets
+3V3: C41.2 FB4.1 ; port +3V3
DGND: C41.1 J1.4 J1.8 ; port DGND
NetFB4_2: FB4.2 J1.5
NetJ1_1: J1.1 ; port TMS
NetJ1_2: J1.2 ; port TRST_N
NetJ1_3: J1.3 ; port TDI
NetJ1_7: J1.7 ; port TDO
NetJ1_9: J1.9 J1.10 ; port TCK

Not connected (* = marked no-connect by the designer): J1 6*

### Notes on the sheet
- TC2050-IDC-430-NL connection scheme <https://www.tag-connect.com/wp-content/uploads/bsk-pdf-manager/TC2050-IDC-430-NL_Datasheet_9.pdf>
- Use  TC2050-IDC-430-NL cable for debug connection
- TI debug connection scheme <https://www.ti.com/lit/ug/spru641/spru641.pdf>
- More details about debug connection from TI <https://software-dl.ti.com/ccs/esd/documents/xdsdebugprobes/emu_jtag_connectors.html#connector-information>
- Title
- Size:
- A4
- Number:
- Revision:
- Date:
- Time:
- Sheet
- of

### Library data of the parts
C41 = CMP-001-2044-2: as C8 on sheet MCU; ComponentLink1URL: https://product.tdk.com/en/search/capacitor/ceramic/mlcc/info?part_no=C1608X8L0J225K080AC; MPN: C1608X8L0J225K080AC; ComponentLink3URL: https://www.digikey.com/en/products/detail/tdk-corporation/C1608X8L0J225K080AC/8343784; ComponentLink1Description: Datasheet; Lead Spacing: 0mm; ComponentLink3Description: Digikey; Package: 0603 (1608 Metric); Height max: 900µm; Size: 1.60mm x 0.80mm; Dielectric: X8L; Ratings: -; Mounting Type: SM; ComponentLink2URL: https://eu.mouser.com/ProductDetail/TDK/C1608X8L0J225K080AC?qs=rrS6PyfT74dgREMaiAoT3Q%3D%3D; ComponentLink2Description: Mouser
FB4 = CMP-001-1981-1: as FB1 on sheet MCU; Mounting Type: SM; Size: 1.60mm x 0.80mm; ComponentLink2URL: https://eu.mouser.com/ProductDetail/Murata-Electronics/BLM18KG221BH1D?qs=sJ5gq5MLFXpgEHYBdWUtkQ%3D%3D; ComponentLink1Description: Datasheet; ComponentLink1URL: https://www.murata.com/en-us/products/productdata/8798137286686/QNFA9129.pdf; Lead Spacing: 0mm; Ratings: AEC-Q200; ComponentLink3Description: Digikey; ComponentLink3URL: https://www.digikey.com/en/products/detail/murata-electronics/BLM18KG221BH1D/6156000; Height max: 950µm; Package: 0603 (1608 Metric); ComponentLink2Description: Mouser; MPN: BLM18KG221BH1D
J1 = CONN_TC2050_NL: PLUG-OF-NAILS 10-PIN W/O LEGS 8"; Manufacturer: Tag-Connect LLC; MPN: TC2050; Series: Plug-Of-Nails™; ComponentLink1Description: Datasheet; ComponentLink1URL: https://www.tag-connect.com/wp-content/uploads/bsk-pdf-manager/TC2050-IDC-NL_Datasheet_8.pdf; ComponentLink2Description: DigiKey; ComponentLink2URL: https://www.digikey.pl/en/products/detail/tag-connect-llc/TC2030-IDC/4571121